# Altium project IG_r3-0-U.PrjPCB (part 1 of 3)
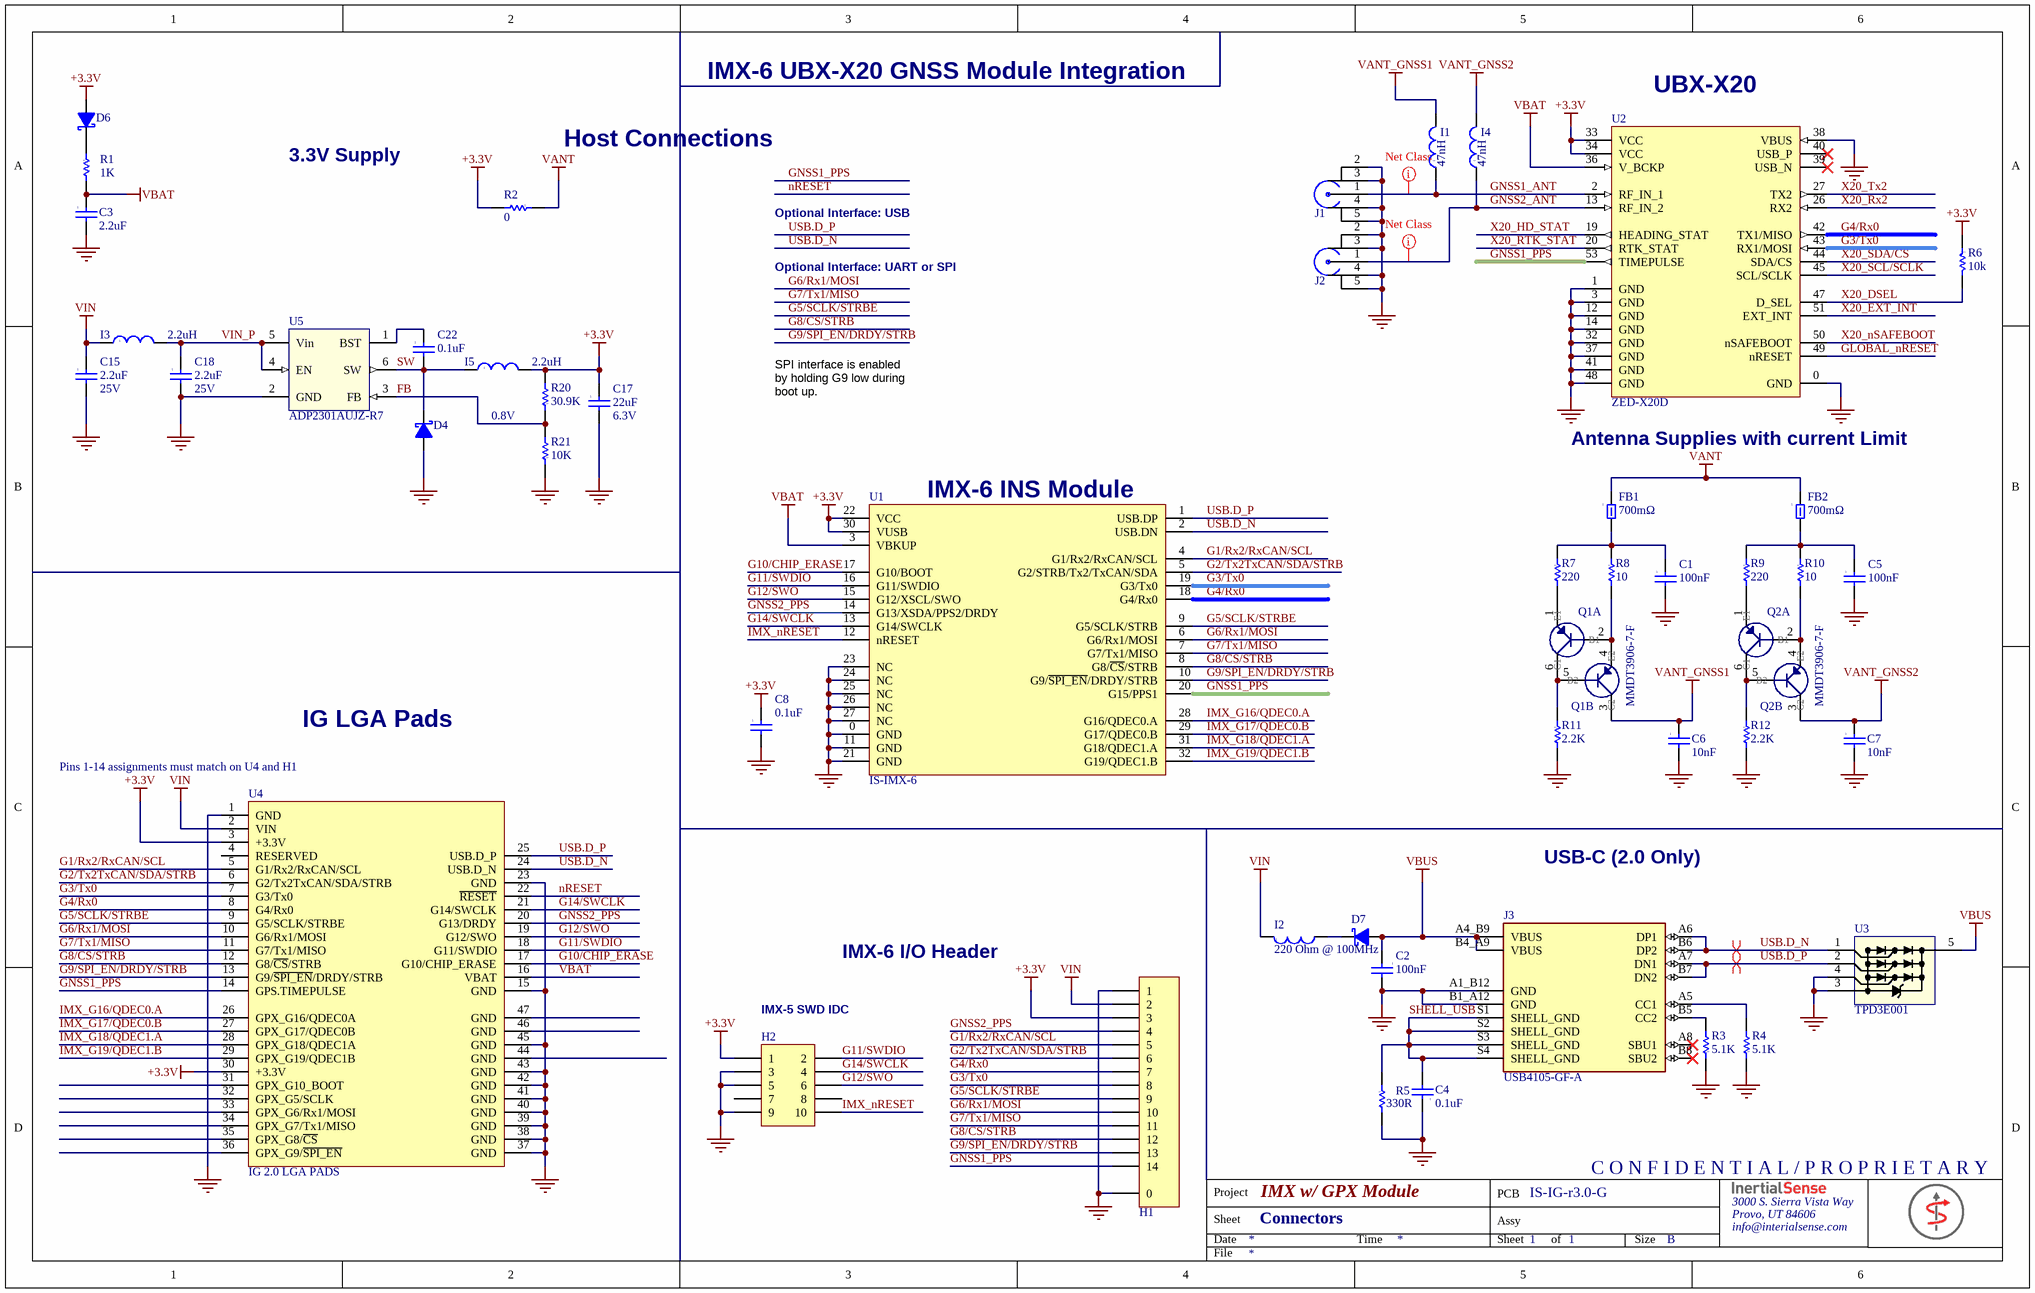
[diagram p0: Main.SchDoc]
AddressLine1: 3000 S. Sierra Vista Way; AddressLine2: Provo, UT 84606; AddressLine3: info@interialsense.com; Company: Inertial Sense, Inc.; PcbPartNumber: IS-IG-r3.0-G; PcbRevision: 3.0.0; ProjectTitle: IMX w/ GPX Module
1 sheet, 48 parts. Net scope: global (net labels, ports and power ports of the same name join across sheets).
Board file: IG-3.PCBDOC

## Sheet Main.SchDoc: Connectors
size B; DocumentNumber: 1; SheetNumber: 1; SheetTotal: 1

### Parts
C1  value 100nF  [0402]  (hidden comment: Cap)
C2  value 100nF  [0402]  (hidden comment: Cap)
C3  value 2.2uF  [0402]  (hidden comment: Cap)
C4  value 0.1uF  [0402]  (hidden comment: Cap)
C5  value 100nF  [0402]  (hidden comment: Cap)
C6  value 10nF  [0402]  (hidden comment: Cap)
C7  value 10nF  [0402]  (hidden comment: Cap)
C8  value 0.1uF  [0402]  (hidden comment: Cap)
C15  value 2.2uF  Voltage Rating: 25V  [0603]  (hidden comment: Cap)
C17  value 22uF  Voltage Rating: 6.3V  [0603]  (hidden comment: Cap)
C18  value 2.2uF  Voltage Rating: 25V  [0603]  (hidden comment: Cap)
C22  value 0.1uF  [0402]  (hidden comment: Cap)
D4  Diode - Schottky  [D0603B]  (value not drawn)
D6  Diode - Schottky  [D0603B]  (value not drawn)
D7  Diode - Schottky  [D0603B]  (value not drawn)
FB1  value 700mΩ  [0402]  (hidden comment: Ferrite Bead)
FB2  value 700mΩ  [0402]  (hidden comment: Ferrite Bead)
H1  Hdr - 14pin - mount  [SM14B-GHS-TB(LF)(SN)]  (value not drawn)
H2  Hdr - 5x2pin  [FTSH-105-01-L-DV-K-A-P]  (value not drawn)
I1  value 47nH  [0402]  (hidden comment: Inductor)
I2  value 220 Ohm @ 100MHz  [I0603]  (hidden comment: Inductor)
I3  value 2.2uH  [0806]  (hidden comment: Inductor)
I4  value 47nH  [0402]  (hidden comment: Inductor)
I5  value 2.2uH  [0806]  (hidden comment: Inductor)
J1  RF - GND x 4  [RF SMA End Launch 2]  (value not drawn)
J2  RF - GND x 4  [RF SMA End Launch 2]  (value not drawn)
J3  USB4105-GF-A  [GCT_USB4105-GF-A]
Q1  Manufacturer Part Number: MMDT3906-7-F  [SOT-363]  (hidden comment: BJT-Dual-PNP)  (parts A,B of 2)
Q2  Manufacturer Part Number: MMDT3906-7-F  [SOT-363]  (hidden comment: BJT-Dual-PNP)  (parts A,B of 2)
R1  value 1K  [R0402]  (hidden comment: Res)
R2  value 0  [R0402]  (hidden comment: Res)
R3  value 5.1K  [R0402]  (hidden comment: Res)
R4  value 5.1K  [R0402]  (hidden comment: Res)
R5  value 330R  [R0402]  (hidden comment: Res)
R6  value 10k  [R0402]  (hidden comment: Res)
R7  value 220  [R0402]  (hidden comment: Res)
R8  value 10  [R0402]  (hidden comment: Res)
R9  value 220  [R0402]  (hidden comment: Res)
R10  value 10  [R0402]  (hidden comment: Res)
R11  value 2.2K  [R0402]  (hidden comment: Res)
R12  value 2.2K  [R0402]  (hidden comment: Res)
R20  value 30.9K  [R0402]  (hidden comment: Res)
R21  value 10K  [R0402]  (hidden comment: Res)
U1  IMX  [IS-IMX-6]  (value not drawn)
U2  ZED-X20D  [ZED-X20]
U3  TPD3E001  [SOTFL50P160X60-5N]
U4  IG 2.0 LGA PADS  [IG-2.0_LGA]  (no BOM)
U5  Manufacturer Part Number: ADP2301AUJZ-R7  [MO-178-AB]  (hidden comment: ADP2301)

### Nets
+3.3V: C8.1 C17.1 D6.A H1.3 H2.1 I5.2 R2.2 R6.1 R20.2 U1.22(VCC) U1.30(VUSB) U2.33(VCC) U2.34(VCC) U4.3(+3.3V) U4.30(+3.3V)
GND: C1.2 C2.2 C3.2 C4.1 C5.2 C6.2 C7.2 C8.2 C15.2 C17.2 C18.2 D4.A H1.0 H1.1 H2.3 H2.5 H2.9 J1.2 J1.3 J1.4 J1.5 J2.2 J2.3 J2.4 J2.5 J3.A1_B12(GND) J3.B1_A12(GND) R3.1 R4.1 R5.2 R11.2 R12.2 R21.1 U1.0(GND) U1.11(GND) U1.21(GND) U1.23(NC) U1.24(NC) U1.25(NC) U1.26(NC) U1.27(NC) U2.0(GND) U2.1(GND) U2.3(GND) U2.12(GND) U2.14(GND) U2.32(GND) U2.37(GND) U2.38(VBUS) U2.41(GND) U2.48(GND) U3.3 U3.4(nc) U4.1(GND) U4.15(GND) U4.23(GND) U4.37(GND) U4.38(GND) U4.39(GND) U4.40(GND) U4.41(GND) U4.42(GND) U4.43(GND) U4.45(GND) U5.2(GND)
VANT: FB1.1 FB2.1 R2.1
VANT_GNSS1: C6.1 I1.2 Q1.3(C2)
VANT_GNSS2: C7.1 I4.2 Q2.3(C2)
VBAT: C3.1 R1.2 U1.3(VBKUP) U2.36(V_BCKP) U4.16(VBAT)
VBUS: C2.1 D7.A J3.A4_B9(VBUS) J3.B4_A9(VBUS) U3.5(nc)
VIN: C15.1 H1.2 I2.1 I3.1 U4.2(VIN)
FB: R20.1 R21.2 U5.3(FB)
G1/Rx2/RxCAN/SCL: H1.5 U1.4(G1/Rx2/RxCAN/SCL) U4.5(G1/Rx2/RxCAN/SCL)
G2/Tx2TxCAN/SDA/STRB: H1.6 U1.5(G2/STRB/Tx2/TxCAN/SDA) U4.6(G2/Tx2TxCAN/SDA/STRB)
G3/Tx0: H1.8 U1.19(G3/Tx0) U2.43(RX1/MOSI) U4.7(G3/Tx0)
G4/Rx0: H1.7 U1.18(G4/Rx0) U2.42(TX1/MISO) U4.8(G4/Rx0)
G5/SCLK/STRBE: H1.9 U1.9(G5/SCLK/STRB) U4.9(G5/SCLK/STRBE)
G6/Rx1/MOSI: H1.10 U1.6(G6/Rx1/MOSI) U4.10(G6/Rx1/MOSI)
G7/Tx1/MISO: H1.11 U1.7(G7/Tx1/MISO) U4.11(G7/Tx1/MISO)
G8/~{CS}/STRB: H1.12 U1.8(G8/~{CS}/STRB) U4.12(G8/~{CS}/STRB)
G9/~{SPI_EN}/DRDY/STRB: H1.13 U1.10(G9/~{SPI_EN}/DRDY/STRB) U4.13(G9/~{SPI_EN}/DRDY/STRB)
G10/CHIP_ERASE: U1.17(G10/BOOT) U4.17(G10/CHIP_ERASE)
G11/SWDIO: H2.2 U1.16(G11/SWDIO) U4.18(G11/SWDIO)
G12/SWO: H2.6 U1.15(G12/XSCL/SWO) U4.19(G12/SWO)
G14/SWCLK: H2.4 U1.13(G14/SWCLK) U4.21(G14/SWCLK)
GLOBAL_nRESET: U2.49(nRESET)
GNSS1_ANT: I1.1 J1.1 U2.2(RF_IN_1)
GNSS1_PPS: H1.14 U1.20(G15/PPS1) U2.53(TIMEPULSE) U4.14(GPS.TIMEPULSE)
GNSS2_ANT: I4.1 J2.1 U2.13(RF_IN_2)
GNSS2_PPS: H1.4 U1.14(G13/XSDA/PPS2/DRDY) U4.20(G13/DRDY)
IMX_G16/QDEC0.A: U1.28(G16/QDEC0.A) U4.26(GPX_G16/QDEC0A)
IMX_G17/QDEC0.B: U1.29(G17/QDEC0.B) U4.27(GPX_G17/QDEC0B)
IMX_G18/QDEC1.A: U1.31(G18/QDEC1.A) U4.28(GPX_G18/QDEC1A)
IMX_G19/QDEC1.B: U1.32(G19/QDEC1.B) U4.29(GPX_G19/QDEC1B)
IMX_nRESET: H2.10 U1.12(nRESET)
nRESET: U4.22(~{RESET})
SHELL_USB: C4.2 J3.S1(SHELL_GND) J3.S2(SHELL_GND) J3.S3(SHELL_GND) J3.S4(SHELL_GND) R5.1
SW: C22.2 D4.C I5.1 U5.6(SW)
USB.D_N: J3.A6(DP1) J3.B6(DP2) U1.2(USB.DN) U3.1 U4.24(USB.D_N)
USB.D_P: J3.A7(DN1) J3.B7(DN2) U1.1(USB.DP) U3.2 U4.25(USB.D_P)
VIN_P: C18.1 I3.2 U5.4(EN) U5.5(Vin)
X20_DSEL: R6.2 U2.47(D_SEL)
X20_EXT_INT: U2.51(EXT_INT)
X20_HD_STAT: U2.19(HEADING_STAT)
X20_nSAFEBOOT: U2.50(nSAFEBOOT)
X20_RTK_STAT: U2.20(RTK_STAT)
X20_Rx2: U2.26(RX2)
X20_SCL/SCLK: U2.45(SCL/SCLK)
X20_SDA/CS: U2.44(SDA/CS)
X20_Tx2: U2.27(TX2)
NetC1_1: C1.1 FB1.2 R7.1 R8.1
NetC5_1: C5.1 FB2.2 R9.1 R10.1
NetC22_1: C22.1 U5.1(BST)
NetD6_C: D6.C R1.1
NetD7_C: D7.C I2.2
NetJ3_A5: J3.A5(CC1) R4.2
NetJ3_B5: J3.B5(CC2) R3.2
NetQ1_1: Q1.1(E1) R7.2
NetQ1_2: Q1.2(B1) Q1.4(E2) R8.2
NetQ1_5: Q1.5(B2) Q1.6(C1) R11.1
NetQ2_1: Q2.1(E1) R9.2
NetQ2_2: Q2.2(B1) Q2.4(E2) R10.2
NetQ2_5: Q2.5(B2) Q2.6(C1) R12.1

Not connected (* = marked no-connect by the designer): H2 7 8; J3 A8(SBU1)* B8(SBU2)*; U2 39(USB_N)* 40(USB_P)*; U4 4(RESERVED) 31(GPX_G10_BOOT) 32(GPX_G5/SCLK) 33(GPX_G6/Rx1/MOSI) 34(GPX_G7/Tx1/MISO) 35(GPX_G8/~{CS}) 36(GPX_G9/~{SPI_EN}) 44(GND) 46(GND) 47(GND)

### Layout directives
differential pair; net class GPX_USB: USB.D_N, USB.D_P
net class RF_GPS: GNSS1_ANT, GNSS2_ANT

### Notes on the sheet
- IMX-6 UBX-X20 GNSS Module Integration
- (near U2) UBX-X20
- 3.3V Supply
- Host Connections
- Optional Interface: USB
- Optional Interface: UART or SPI
- 0.8V
- SPI interface is enabled by holding G9 low during boot up.
- (near U1) IMX-6 INS Module
- Antenna Supplies with current Limit
- (near U4) Pins 1-14 assignments must match on U4 and H1
- IG LGA Pads
- USB-C (2.0 Only)
- IMX-6 I/O Header
- (near H2) IMX-5 SWD IDC
- C O N F I D E N T I A L / P R O P R I E T A R Y
- Date
- Sheet
- Project
- Time
- PCB
- Assy
- of
- Size
- B
- File